# Altium project PowerCutMonitor-v1.0.PrjPcb
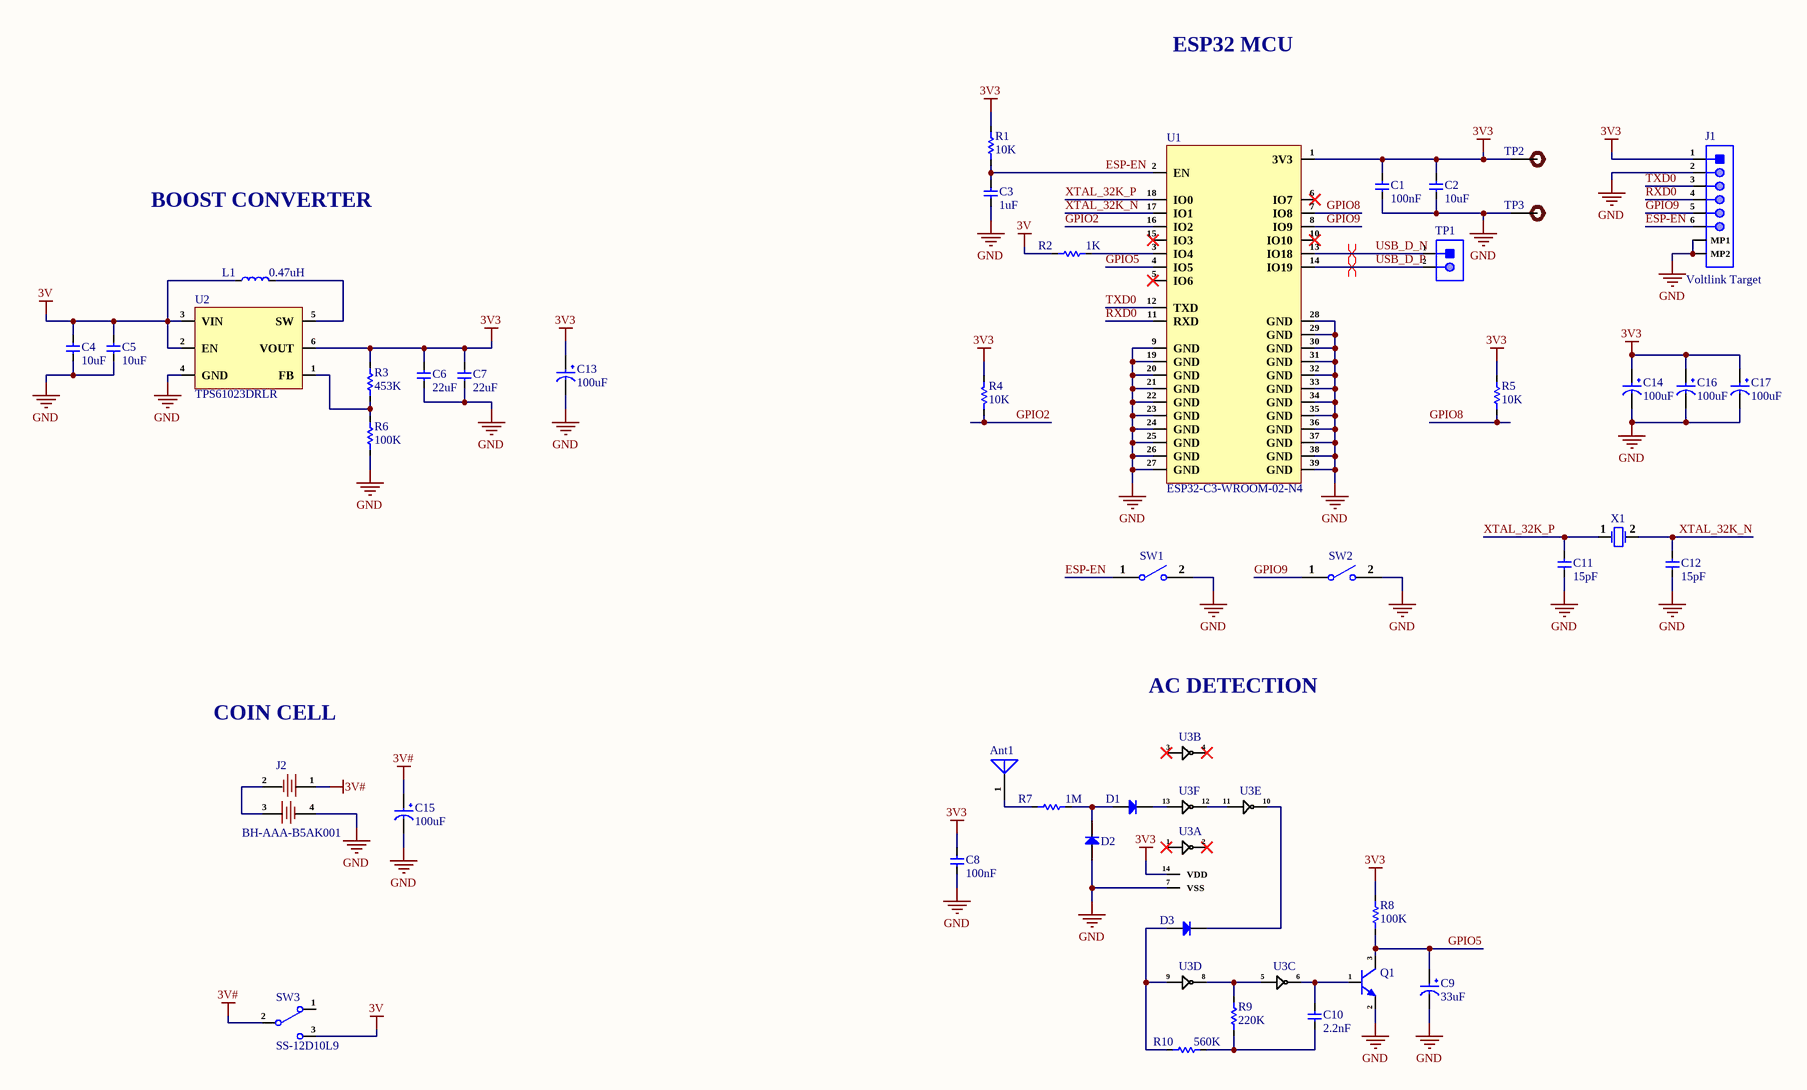
[diagram p0: Monitor-v1.0.SchDoc]
1 sheet, 45 parts. Net scope: global (net labels, ports and power ports of the same name join across sheets).
Board file: PowerCutMonitor-v1.0.PcbDoc

## Sheet Monitor-v1.0.SchDoc
size 420 x 297 mm; SheetNumber: 1; SheetTotal: 1

### Parts
Ant1  BW315SNX39-6W3  [BW315SNX39-6W3]  (value not drawn)
C1  100nF  [cap-0402]
C2  10uF  [Cap-0402]
C3  1uF  [Cap-0402]
C4  10uF  [Cap-0402]
C5  10uF  [Cap-0402]
C6  22uF  [Cap-0603]
C7  22uF  [Cap-0603]
C8  100nF  [cap-0402]
C9  33uF  [Case-B]
C10  2.2nF  [Cap-0402]
C11  15pF  [Cap-0402]
C12  15pF  [Cap-0402]
C13  100uF  [Case-B]
C14  100uF  [Case-B]
C15  100uF  [Case-B]
C16  100uF  [Case-B]
C17  100uF  [Case-B]
D1  1N4148W-7-F  [SOD-123]  (value not drawn)
D2  1N4148W-7-F  [SOD-123]  (value not drawn)
D3  1N4148W-7-F  [SOD-123]  (value not drawn)
J1  Voltlink Target  [Voltlink Target]
J2  BH-AAA-B5AK001  [BH-AAA-B5AK001]
L1  0.47uH  [SPM3015-R47N]
Q1  BC847C,215  [SOT-23]  (value not drawn)
R1  10K  [Res-0402]
R2  1K  [Res-0402]
R3  453K  [Res-0402]
R4  10K  [Res-0402]
R5  10K  [Res-0402]
R6  100K  [Res-0402]
R7  1M  [Res-0402]
R8  100K  [Res-0402]
R9  220K  [Res-0402]
R10  560K  [Res-0402]
SW1  B3U-1000P  [B3U-1000P]  (value not drawn)
SW2  B3U-1000P  [B3U-1000P]  (value not drawn)
SW3  SS-12D10L9  [SS-12D10L9]
TP1  2 Test Pad  [2 Test Pad]  (value not drawn)  (no BOM)
TP2  TEST POINT 0.5mm Dia  [Test-point - 0.5mm]  (value not drawn)  (no BOM)
TP3  TEST POINT 0.5mm Dia  [Test-point - 0.5mm]  (value not drawn)  (no BOM)
U1  ESP32-C3-WROOM-02-N4  [ESP32-C3-WROOM-02-N4]
U2  TPS61023DRLR  [SOT-563]
U3  CD4069  [SOP-14]  (value not drawn)  (parts A,B,C,D,E,F of 6)
X1  Q13FC13500004  [SMD3215-2P]  (value not drawn)

### Nets
3V: C4.2 C5.2 L1.1 R2.2 SW3.3 U2.2(EN) U2.3(VIN)
3V3: C1.2 C2.2 C6.2 C7.2 C8.2 C13.1 C14.1 C16.1 C17.1 J1.1 R1.2 R3.2 R4.2 R5.2 R8.2 TP2.1 U1.1(3V3) U2.6(VOUT) U3.14(VDD)
3V#: C15.1 J2.1 SW3.2
GND: C1.1 C2.1 C3.1 C4.1 C5.1 C6.1 C7.1 C8.1 C9.2 C11.1 C12.1 C13.2 C14.2 C15.2 C16.2 C17.2 D2.1(A) J1.2 J1.MP1 J1.MP2 J2.4 Q1.2(E) R6.1 SW1.2 SW2.2 TP3.1 U1.9(GND) U1.19(GND) U1.20(GND) U1.21(GND) U1.22(GND) U1.23(GND) U1.24(GND) U1.25(GND) U1.26(GND) U1.27(GND) U1.28(GND) U1.29(GND) U1.30(GND) U1.31(GND) U1.32(GND) U1.33(GND) U1.34(GND) U1.35(GND) U1.36(GND) U1.37(GND) U1.38(GND) U1.39(GND) U2.4(GND) U3.7(VSS)
ESP-EN: C3.2 J1.6 R1.1 SW1.1 U1.2(EN)
GPIO2: R4.1 U1.16(IO2)
GPIO5: C9.1 Q1.3(C) R8.1 U1.4(IO5)
GPIO8: R5.1 U1.7(IO8)
GPIO9: J1.5 SW2.1 U1.8(IO9)
RXD0: J1.4 U1.11(RXD)
TXD0: J1.3 U1.12(TXD)
USB_D_N: TP1.1 U1.13(IO18)
USB_D_P: TP1.2 U1.14(IO19)
XTAL_32K_N: C12.2 U1.17(IO1) X1.2(OSC2)
XTAL_32K_P: C11.2 U1.18(IO0) X1.1(OSC1)
NetAnt1_1: Ant1.1(FEED) R7.1
NetC10_1: C10.1 R9.1 R10.2
NetC10_2: C10.2 Q1.1(B) U3.6(Y3)
NetD1_1: D1.1(A) D2.2(K) R7.2
NetD1_2: D1.2(K) U3.13(A6)
NetD3_1: D3.1(A) R10.1 U3.9(A4)
NetD3_2: D3.2(K) U3.10(Y5)
NetJ2_2: J2.2 J2.3
NetL1_2: L1.2 U2.5(SW)
NetR2_1: R2.1 U1.3(IO4)
NetR3_1: R3.1 R6.2 U2.1(FB)
NetR9_2: R9.2 U3.5(A3) U3.8(Y4)
NetU3_11: U3.11(A5) U3.12(Y6)

Not connected (* = marked no-connect by the designer): SW3 1; U1 5(IO6)* 6(IO7)* 10(IO10)* 15(IO3)*; U3 1(A1)* 2(Y1)* 3(A2)* 4(Y2)*

### Layout directives
differential pair; net class USB_LINES: USB_D_N, USB_D_P

### Notes on the sheet
- ESP32 MCU
- BOOST CONVERTER
- COIN CELL
- AC DETECTION
- File:
- Title:
- Date:
- Page
- Num:
- Total:
- Drawn By: Huzaifa Ali

### Library data of the parts
Ant1 = BW315SNX39-6W3: 1.8 3dBi Vertical 50W Antennas ROHS; Manufacturer: BAT WIRELESS; Manufacturer Part Number: BW315SNX39-6W3; Package: Custom; LCSC Part Number: C496553; Item Type: Antenna; ComponentLink1Description: LCSC; ComponentLink1URL: https://www.lcsc.com/product-detail/Antennas_BAT-WIRELESS-BW315SNX39-6W3_C496553.html
C1 C8 = C1005X7R1H104KT000F: CAP CER 0.1UF 50V X7R 0402; Manufacturer: TDK; Tolerance: 10%; Voltage: 25V; Item Type: Capacitor; Supplier 1: Avnet; Manufacturer Part Number: C1005X7R1H104KT000F; RoHS: No; Category: Ceramic Capacitors; Dielectric: X7R; Supplier Part Number 1: C1005X7R1H104KT000F; LCSC Part Number: C361198; ComponentLink1Description: LCSC; ComponentLink1URL: https://www.lcsc.com/product-detail/Multilayer-Ceramic-Capacitors-MLCC-SMD-SMT_TDK-C1005X7R1H104KT000F_C361198.html
C2 C4 C5 = CC0402MRX5R6BB106: CAP CER 10UF 10V X5R 0402; Manufacturer: Yageo; Tolerance: 20%; Item Type: Capacitor; Supplier 1: Future Electronics; Manufacturer Part Number: CC0402MRX5R6BB106; RoHS: Yes; Category: Ceramic Capacitors; Stock 1: 80000; Pricing 1: 10000=0.02650, 20000=0.02590, 30000=0.02550, 40000=0.02530, 50000=0.02450 (USD); Mount: Surface Mount; Case/Package: 0402; Case Code (Imperial): 0402; Case Code (Metric): 1005; Min Operating Temperature: -55°C; Max Operating Temperature: 85°C; Packaging: Tape and Reel; Capacitance: 10uF; Voltage Rating: 10V; RoHS Compliant: Yes; ComponentLink1URL: http://www.yageo.com/documents/recent/UPY-GPHC_X5R_4V-to-50V_25.pdf?src-supplier=Digi-Key; ComponentLink1Description: http://www.yageo.com/documents/recent/UPY-GPHC_X5R_4V-to-50V_25.pdf?src-supplier=Digi-Key; Supplier Part Number 1: 6097631; LCSC Part Number: C962143
C3 = CC0402KRX5R7BB105: CAP CER 1UF 16V X5R 0402; Manufacturer: Yageo; Tolerance: 10%; Item Type: Capacitor; Supplier 1: Digi-Key; Manufacturer Part Number: CC0402KRX5R7BB105; Stock 1: 1405667; Pricing 1: 1=0.36, 10=0.252, 100=0.1512, 500=0.1134, 1000=0.09576, 2500=0.09072, 5000=0.08568 (USD); Mount: Surface Mount; Case/Package: 0402; Weight: 2.3E-05oz; Case Code (Imperial): 0402; Case Code (Metric): 1005; Min Operating Temperature: -55°C; Max Operating Temperature: 85°C; Capacitance: 1uF; Dielectric: X5R; Packaging: Tape and Reel; Voltage Rating (DC): 16V; Voltage Rating: 16V; Termination: SMD/SMT; Composition: Ceramic; Length: 1mm; Height: 0.5mm; Width: 0.02inch; Thickness: 0.022inch; Depth: 0.5mm; Radiation Hardening: No; Lead Free: Lead Free; Halogen Free: Halogen Free; ComponentLink1URL: http://www.yageo.com/documents/recent/UPY-GPHC_X5R_4V-to-50V_12.pdf?src-supplier=Avnet+Europe; ComponentLink1Description: http://www.yageo.com/documents/recent/UPY-GPHC_X5R_4V-to-50V_12.pdf?src-supplier=Avnet+Europe; Supplier Part Number 1: 311-1691-6-ND; LCSC Part Number: C325464
C6 C7 = CC0603MRX5R5BB226: CAP CER 22UF 6.3V X5R 0603; Manufacturer: Yageo; Tolerance: 20%; Supplier 1: Mouser; Manufacturer Part Number: CC0603MRX5R5BB226; RoHS: Yes; Category: Ceramic Capacitors; Stock 1: 3030; Pricing 1: 1=0.33000, 10=0.22500, 50=0.22500, 100=0.12800, 1000=0.07900, 10000=0.06500 (USD); Mount: Surface Mount; Case/Package: 0603; Case Code (Metric): 1608; Case Code (Imperial): 0603; Weight: 7.1E-05oz; Min Operating Temperature: -55°C; Max Operating Temperature: 85°C; Capacitance: 22uF; Packaging: Tape and Reel; Dielectric: X5R; Voltage Rating: 6.3V; Termination: SMD/SMT; Resistor Type: Ceramic; Voltage Rating (DC): 6.3V; Package Quantity: 4000; Length: 0.063inch; Width: 0.031inch; Thickness: 0.035inch; Depth: 0.8mm; Lead Free: Lead Free; Halogen Free: Halogen Free; RoHS Compliant: Yes; ComponentLink1URL: http://www.mouser.com/ds/2/447/Yageo_UPY-GP_NP0_16V-to-50V_9-358835.pdf?src-supplier=Mouser; ComponentLink1Description: http://www.mouser.com/ds/2/447/Yageo_UPY-GP_NP0_16V-to-50V_9-358835.pdf?src-supplier=Mouser; ComponentLink2URL: http://www.yageo.com/documents/recent/UPY-GPHC_X5R_4V-to-50V_25.pdf?src-supplier=Digi-Key; ComponentLink2Description: http://www.yageo.com/documents/recent/UPY-GPHC_X5R_4V-to-50V_25.pdf?src-supplier=Digi-Key; Supplier Part Number 1: 603-CC603MRX5R5BB226; LCSC Part Number: C109448
C9 = TAJB336K010RNJ: CAP TANT 33UF 10% 10V 1411; Manufacturer: Kyocera AVX; Dielectric Material: Tantalum; ESR (Equivalent Series Resistance): 1.8R; Leakage Current: 3.3uA; Polarity: Polar; Dissipation Factor: 6%; Item Type: Capacitor; Supplier 1: Rs; Manufacturer Part Number: TAJB336K010RNJ; RoHS: Yes; Category: Tantalum Capacitors; Stock 1: 1580; Pricing 1: 100=0.01410, 400=0.24800, 1000=0.21600 (GBP); Mounting Technology: Surface Mount,PCB; Case/Package: 1210; Pins: 2; Case Code (Metric): 3528; Case Code (Imperial): 1210; Min Operating Temperature: -55°C; Max Operating Temperature: 125°C; Tolerance: 10%; Value: 33uF; Packaging: Tape and Reel; Voltage Rating: 10V; Voltage Rating (DC): 10V; Package Quantity: 1; Termination: SMD/SMT; Voltage: 10V; Features: General Purpose; Series: TAJ; Construction: Flat; Length: 3.5mm; Width: 2.8mm; Height: 1.9mm; Height - Seated (Max): 0.083inch; Depth: 2.8mm; Lead Pitch: 1.4mm; Radiation Hardening: No; Reach SVHC Compliant: Yes; Lead Free: Lead Free; RoHS Compliant: Yes; ComponentLink1URL: https://datasheet.ciiva.com/26341/559435-da-01-en-tacc-b-3-2-mm-x-2-5-mm-x-1-9-mm-33-uf-26341776.pdf?src-supplier=Conrad; ComponentLink1Description: https://datasheet.ciiva.com/26341/559435-da-01-en-tacc-b-3-2-mm-x-2-5-mm-x-1-9-mm-33-uf-26341776.pdf?src-supplier=Conrad; ComponentLink2URL: https://datasheet.ciiva.com/7775/49917-7775706.pdf?src-supplier=Element14; ComponentLink2Description: https://datasheet.ciiva.com/7775/49917-7775706.pdf?src-supplier=Element14; ComponentLink3URL: https://datasheet.ciiva.com/7775/49917-7775705.pdf?src-supplier=Element14; ComponentLink3Description: https://datasheet.ciiva.com/7775/49917-7775705.pdf?src-supplier=Element14; ComponentLink4URL: https://datasheet.ciiva.com/7775/1680476-7775704.pdf?src-supplier=Element14; ComponentLink4Description: https://datasheet.ciiva.com/7775/1680476-7775704.pdf?src-supplier=Element14; ComponentLink5URL: https://datasheet.ciiva.com/264/taj-264134.pdf?src-supplier=Digi-Key; ComponentLink5Description: https://datasheet.ciiva.com/264/taj-264134.pdf?src-supplier=Digi-Key; ComponentLink6URL: https://datasheet.ciiva.com/264/taj-264133.pdf?src-supplier=Digi-Key; ComponentLink6Description: https://datasheet.ciiva.com/264/taj-264133.pdf?src-supplier=Digi-Key; ComponentLink7URL: https://datasheet.ciiva.com/264/taj-264135.pdf?src-supplier=Digi-Key; ComponentLink7Description: https://datasheet.ciiva.com/264/taj-264135.pdf?src-supplier=Digi-Key; ComponentLink8URL: https://datasheet.ciiva.com/12884/taj-27497-12884279.pdf?src-supplier=Mouser; ComponentLink8Description: https://datasheet.ciiva.com/12884/taj-27497-12884279.pdf?src-supplier=Mouser; ComponentLink9URL: https://datasheet.ciiva.com/14590/70001050-14590215.pdf?src-supplier=Allied+Electronics; ComponentLink9Description: https://datasheet.ciiva.com/14590/70001050-14590215.pdf?src-supplier=Allied+Electronics; ComponentLink10URL: https://datasheet.ciiva.com/14592/70001050-14592670.pdf?src-supplier=Allied+Electronics; ComponentLink10Description: https://datasheet.ciiva.com/14592/70001050-14592670.pdf?src-supplier=Allied+Electronics; ComponentLink11URL: https://datasheet.ciiva.com/11224/taj-11224937.pdf?src-supplier=Avnet; ComponentLink11Description: https://datasheet.ciiva.com/11224/taj-11224937.pdf?src-supplier=Avnet; ComponentLink12URL: https://datasheet.ciiva.com/16492/taj-16492863.pdf?src-supplier=Future+Electronics; ComponentLink12Description: https://datasheet.ciiva.com/16492/taj-16492863.pdf?src-supplier=Future+Electronics; ComponentLink13URL: https://datasheet.ciiva.com/11224/taj-11224941.pdf?src-supplier=Avnet; ComponentLink13Description: https://datasheet.ciiva.com/11224/taj-11224941.pdf?src-supplier=Avnet; Supplier Part Number 1: 1364604P; LCSC Part Number: C7202
C10 = 04025C222JAT2A: CAP CER 2.2nF 50V X7R ±5% 0402 MLCC - SMD/SMT ROHS; Manufacturer: Kyocera AVX; Item Type: Capacitor; Manufacturer Part Number: 04025C222JAT2A; Package: 0402; LCSC Part Number: C597041; ComponentLink1Description: LCSC; ComponentLink1URL: https://www.lcsc.com/product-detail/Multilayer-Ceramic-Capacitors-MLCC-SMD-SMT_Kyocera-AVX-04025C222JAT2A_C597041.html
C11 C12 = CQ0402GRNPO9BN150: CAP CER 15PF 50V C0G/NPO 0402; Manufacturer: Yageo; Item Type: Capacitors; Tolerance: 2%; Dielectric: C0G; Supplier: Digikey; LCSC Part Number: C577406; Manufacturer Part Number: CQ0402GRNPO9BN150; RoHS: Yes; Pricing: 10000=0.04366 (USD); Mounting Technology: Surface Mount; Case/Package: 0402; Case Code (Imperial): 0402; Case Code (Metric): 1005; Weight: 2.3E-05oz; Min Operating Temperature: -55°C; Max Operating Temperature: 125°C; Value: 15pF; Packaging: Tape and Reel; Voltage Rating: 50V; Voltage Rating (DC): 50V; Package Quantity: 10000; Series: CQ; ComponentLink1URL: http://www.mouser.com/ds/2/447/UPY-High%20Q_NP0_16V-to-250V_11-533944.pdf?src-supplier=Mouser; ComponentLink1Description: http://www.mouser.com/ds/2/447/UPY-High%20Q_NP0_16V-to-250V_11-533944.pdf?src-supplier=Mouser; ComponentLink2URL: http://www.yageo.com/documents/recent/UPY-High%20Q_NP0_16V-to-250V_13.pdf?src-supplier=Digikey; ComponentLink2Description: http://www.yageo.com/documents/recent/UPY-High%20Q_NP0_16V-to-250V_13.pdf?src-supplier=Digikey
C13-C17 = TPSB107M006R0250: CAP TANT 100UF 20% 6.3V 1411; Manufacturer: Kyocera AVX; Item Type: Tantalum Capacitors; Supplier: Digikey; LCSC Part Number: C283239; Manufacturer Part Number: TPSB107M006R0250; RoHS: Yes; Stock: 19045; Pricing: 1=0.8, 10=0.504, 50=0.3874, 100=0.3515, 500=0.29072, 1000=0.27195 (USD); ComponentLink1URL: https://datasheet.ciiva.com/16501/tps-16501597.pdf?src-supplier=Future+Electronics; ComponentLink1Description: https://datasheet.ciiva.com/16501/tps-16501597.pdf?src-supplier=Future+Electronics; ComponentLink2URL: https://datasheet.ciiva.com/3004/tps-3004598.pdf?src-supplier=Avnet; ComponentLink2Description: https://datasheet.ciiva.com/3004/tps-3004598.pdf?src-supplier=Avnet; ComponentLink3URL: https://datasheet.ciiva.com/264/tps-264115.pdf?src-supplier=Digikey; ComponentLink3Description: https://datasheet.ciiva.com/264/tps-264115.pdf?src-supplier=Digikey; ComponentLink4URL: https://datasheet.ciiva.com/264/tps-264116.pdf?src-supplier=Digikey; ComponentLink4Description: https://datasheet.ciiva.com/264/tps-264116.pdf?src-supplier=Digikey; ComponentLink5URL: https://datasheet.ciiva.com/264/tps-264117.pdf?src-supplier=Digikey; ComponentLink5Description: https://datasheet.ciiva.com/264/tps-264117.pdf?src-supplier=Digikey
D1-D3 = 1N4148W-7-F: DIODE GEN PURP 100V 300MA SOD123; Manufacturer: Diodes; Forward Current: 150mA; Reverse Recovery Time: 4ns; Max Forward Surge Current (Ifsm): 2A; Element Configuration: Single; Max Reverse Current: 1uA; Forward Voltage: 1.25V; Power Dissipation: 400mW; Polarity: Standard; Voltage Rating (DC): 75V; Value: 2pF; Supplier 1: Future Electronics; Manufacturer Part Number: 1N4148W-7-F; RoHS: Yes; Category: Rectifier Diodes; Stock 1: 32931000; Pricing 1: 3000=0.01840, 12000=0.01760, 45000=0.01690, 120000=0.01640, 300000=0.01560 (USD); Mounting Technology: Surface Mount; Pins: 2; Weight: 0.000353oz; Contact Plating: Tin,Matte; Min Operating Temperature: -65°C; Max Operating Temperature: 150°C; Packaging: Tape and Reel; Max Repetitive Reverse Voltage (Vrrm): 100V; Peak Non-Repetitive Surge Current: 2A; Voltage: 100V; Max Surge Current: 2A; Package Quantity: 3000; Recovery Time: 4ns; Average Rectified Current: 300mA; Power Rating: 400mW; Current Rating: 150mA; Output Current: 150mA; Max Reverse Voltage (DC): 100V; Series: -; Reverse Recovery Time-Max: 4ns; Length: 2.85mm; Width: 1.7mm; Height: 1.25mm; Radiation Hardening: No; RoHS Compliant: Yes; Reach SVHC Compliant: Yes; Lead Free: Lead Free; ComponentLink1URL: https://datasheet.ciiva.com/1179/1915529-1179304.pdf?src-supplier=Element14; ComponentLink1Description: https://datasheet.ciiva.com/1179/1915529-1179304.pdf?src-supplier=Element14; ComponentLink2URL: https://datasheet.ciiva.com/22695/1915529-22695239.pdf?src-supplier=Element14; ComponentLink2Description: https://datasheet.ciiva.com/22695/1915529-22695239.pdf?src-supplier=Element14; ComponentLink3URL: https://datasheet.ciiva.com/8300/ds30086-8300392.pdf?src-supplier=Avnet; ComponentLink3Description: https://datasheet.ciiva.com/8300/ds30086-8300392.pdf?src-supplier=Avnet; ComponentLink4URL: https://datasheet.ciiva.com/15219/getdatasheetpartid-110030-15219548.pdf?src-supplier=Verical; ComponentLink4Description: https://datasheet.ciiva.com/15219/getdatasheetpartid-110030-15219548.pdf?src-supplier=Verical; ComponentLink5URL: https://datasheet.ciiva.com/8303/ds30086-8303197.pdf?src-supplier=Avnet; ComponentLink5Description: https://datasheet.ciiva.com/8303/ds30086-8303197.pdf?src-supplier=Avnet; ComponentLink6URL: https://datasheet.ciiva.com/911/ds30086-911735.pdf?src-supplier=Digi-Key; ComponentLink6Description: https://datasheet.ciiva.com/911/ds30086-911735.pdf?src-supplier=Digi-Key; ComponentLink7URL: https://datasheet.ciiva.com/911/ds30086-911736.pdf?src-supplier=Digi-Key; ComponentLink7Description: https://datasheet.ciiva.com/911/ds30086-911736.pdf?src-supplier=Digi-Key; ComponentLink8URL: https://datasheet.ciiva.com/911/ds30086-911734.pdf?src-supplier=Digi-Key; ComponentLink8Description: https://datasheet.ciiva.com/911/ds30086-911734.pdf?src-supplier=Digi-Key; ComponentLink9URL: https://datasheet.ciiva.com/4435/ds30086-4435128.pdf?src-supplier=Mouser; ComponentLink9Description: https://datasheet.ciiva.com/4435/ds30086-4435128.pdf?src-supplier=Mouser; Supplier Part Number 1: 7634694; LCSC Part Number: C83528; Item Type: Diode
J1 = C145963: 1x6P SH 1 1mm 6 SMD,P=1mm Wire To Board / Wire To Wire Connector ROHS; Manufacturer: BOOMELE; Manufacturer Part Number: C145963; Package: SMD,P=1mm; LCSC Part Number: C145963; Item Type: Connector; ComponentLink1Description: LCSC; ComponentLink1URL: https://www.lcsc.com/product-detail/Wire-To-Board-Wire-To-Wire-Connector_BOOMELE-Boom-Precision-Elec-C145963_C145963.html
J2 = BH-AAA-B5AK001: Battery box Tin -25℃~+85℃ Phosphor Bronze No. 7 SMD Button And Strip Battery Connector ROHS; Manufacturer: MYOUNG; Item Type: Battery Holder; Manufacturer Part Number: BH-AAA-B5AK001; Package: SMD; LCSC Part Number: C964882; ComponentLink1Description: LCSC; ComponentLink1URL: https://www.lcsc.com/product-detail/Button-And-Strip-Battery-Connector_MYOUNG-BH-AAA-B5AK001_C964882.html
L1 = SPM3015-R47N: 3.7A 0.47uH ±30% 6A 1212 Power Inductors ROHS; Manufacturer: KOHERelec; Manufacturer Part Number: SPM3015-R47N; Package: 1212; LCSC Part Number: C2761886; Item Type: Inductor; ComponentLink1Description: LCSC; ComponentLink1URL: https://www.lcsc.com/product-detail/Power-Inductors_KOHERelec-SPM3015-R47N_C2761886.html?s_z=n_744383350047
Q1 = BC847C,215: TRANS NPN 45V 0.1A TO-236AB; Manufacturer: Nexperia; Item Type: BJTs; Polarity: 5054Direction; Supplier: Future Electronics; LCSC Part Number: C8664; Manufacturer Part Number: BC847C,215; RoHS: Yes; Stock: 18000; Pricing: 3000=0.0084, 12000=0.0081, 30000=0.0079, 75000=0.0077, 120000=0.0074 (USD); Pins: 3NUMBER; Packaging: 13Packaging; RoHS Compliant: Yes; ComponentLink1URL: http://www.farnell.com/datasheets/1856333.pdf?src-supplier=Farnell; ComponentLink1Description: http://www.farnell.com/datasheets/1856333.pdf?src-supplier=Farnell; ComponentLink2URL: https://assets.nexperia.com/documents/data-sheet/BC847_SER.pdf?src-supplier=Digikey; ComponentLink2Description: https://assets.nexperia.com/documents/data-sheet/BC847_SER.pdf?src-supplier=Digikey; ComponentLink3URL: https://datasheet.octopart.com/BC847C%2C215-NXP-Semiconductors-datasheet-20734447.pdf?src-supplier=Farnell; ComponentLink3Description: https://datasheet.octopart.com/BC847C%2C215-NXP-Semiconductors-datasheet-20734447.pdf?src-supplier=Farnell; ComponentLink4URL: https://datasheet.octopart.com/BC847C%2C215-Nexperia-datasheet-164345412.pdf?src-supplier=Future+Electronics; ComponentLink4Description: https://datasheet.octopart.com/BC847C%2C215-Nexperia-datasheet-164345412.pdf?src-supplier=Future+Electronics; ComponentLink5URL: https://datasheet.octopart.com/BC847C%2C215-Nexperia-datasheet-11982477.pdf?src-supplier=Newark; ComponentLink5Description: https://datasheet.octopart.com/BC847C%2C215-Nexperia-datasheet-11982477.pdf?src-supplier=Newark; ComponentLink6URL: https://datasheet.octopart.com/BC847C%2C215-Nexperia-datasheet-5341283.pdf?src-supplier=TME; ComponentLink6Description: https://datasheet.octopart.com/BC847C%2C215-Nexperia-datasheet-5341283.pdf?src-supplier=TME
R1 R4 R5 = RC0402FR-0710KL: RES 10K OHM 1% 1/16W 0402; Manufacturer: Yageo; Resistance: 10kR; Voltage Rating (DC): 50V; Temperature Coefficient: 100ppm/°C; Power Rating: 62.5mW; Max Power Dissipation: 63mW; Item Type: Resistor; Supplier 1: Mouser; Manufacturer Part Number: RC0402FR-0710KL; RoHS: Yes; Category: Chip SMD Resistors; Stock 1: 18648329; Pricing 1: 1=0.10000, 10=0.01400, 50=0.01400, 100=0.00500, 1000=0.00300, 10000=0.00200 (USD); Case/Package: 0402; Number of Pins: 2; Case Code (Imperial): 0402; Case Code (Metric): 1005; Min Operating Temperature: -55°C; Max Operating Temperature: 155°C; Resistor Type: Thick Film; Tolerance: 1%; Packaging: Tape and Reel; Voltage Rating: 50V; Termination: SMD/SMT; Working Voltage: 50V; Number of Terminations: 2; Features: Moisture Resistant; Series: RC; Resistance Tolerance: 1%; Construction: Rectangular; Length: 1mm; Width: 0.5mm; Height: 0.32mm; Depth: 0.5mm; Lead Pitch: 0.2mm; REACH SVHC: No SVHC; Lead Free: Lead Free; RoHS Compliant: Yes; Military Standard: Not; ComponentLink1URL: https://datasheet.ciiva.com/7660/38568-7660787.pdf?src-supplier=Element14; ComponentLink1Description: https://datasheet.ciiva.com/7660/38568-7660787.pdf?src-supplier=Element14; ComponentLink2URL: https://datasheet.ciiva.com/7849/1686128-7849814.pdf?src-supplier=Element14; ComponentLink2Description: https://datasheet.ciiva.com/7849/1686128-7849814.pdf?src-supplier=Element14; ComponentLink3URL: https://datasheet.ciiva.com/7983/1018594-7983486.pdf?src-supplier=Element14; ComponentLink3Description: https://datasheet.ciiva.com/7983/1018594-7983486.pdf?src-supplier=Element14; ComponentLink4URL: https://datasheet.ciiva.com/22747/1018594-22747512.pdf?src-supplier=Element14; ComponentLink4Description: https://datasheet.ciiva.com/22747/1018594-22747512.pdf?src-supplier=Element14; ComponentLink5URL: https://datasheet.ciiva.com/12667/pyu-rc0402-51-rohs-l-6-r-12667067.pdf?src-supplier=Mouser; ComponentLink5Description: https://datasheet.ciiva.com/12667/pyu-rc0402-51-rohs-l-6-r-12667067.pdf?src-supplier=Mouser; ComponentLink6URL: https://datasheet.ciiva.com/7849/1784430-7849813.pdf?src-supplier=Element14; ComponentLink6Description: https://datasheet.ciiva.com/7849/1784430-7849813.pdf?src-supplier=Element14; ComponentLink7URL: https://datasheet.ciiva.com/7849/1784430-7849815.pdf?src-supplier=Element14; ComponentLink7Description: https://datasheet.ciiva.com/7849/1784430-7849815.pdf?src-supplier=Element14; Supplier Part Number 1: 603-RC0402FR-0710KL; LCSC Part Number: C60490
R2 = RC0402FR-071KL: RES 1K OHM 1% 1/16W 0402; Manufacturer: Yageo; Resistance: 1kR; Temperature Coefficient: 100ppm/°C; Voltage Rating (DC): 50V; Power Rating: 62.5mW; Max Power Dissipation: 63mW; Item Type: Resistor; Supplier 1: Avnet; Manufacturer Part Number: RC0402FR-071KL; RoHS: Yes; Category: Chip SMD Resistors; Stock 1: 13030000; Pricing 1: 10000=0.00085, 20000=0.00087, 40000=0.00084, 60000=0.00083, 80000=0.00079, 100000=0.00078, 1000000=0.00076 (USD); Case/Package: 0402; Number of Pins: 2; Case Code (Imperial): 0402; Case Code (Metric): 1005; Size Code: 0402; Min Operating Temperature: -55°C; Max Operating Temperature: 155°C; Resistor Type: Thick Film; Tolerance: 1%; Packaging: Tape and Reel; Voltage Rating: 50V; Termination: SMD/SMT; Features: Moisture Resistant; Series: RC; Number of Terminations: 2; Resistance Tolerance: 1%; Construction: Rectangular; Technology: THICK FILM; Length: 1mm; Width: 0.5mm; Height: 0.32mm; Depth: 0.5mm; Reach SVHC Compliant: Yes; Lead Free: Lead Free; RoHS Compliant: Yes; Military Standard: Not; ComponentLink1URL: https://datasheet.ciiva.com/11819/0900766b80c66297-11819477.pdf?src-supplier=RSComponents; ComponentLink1Description: https://datasheet.ciiva.com/11819/0900766b80c66297-11819477.pdf?src-supplier=RSComponents; ComponentLink2URL: https://datasheet.ciiva.com/7983/1018594-7983502.pdf?src-supplier=Element14; ComponentLink2Description: https://datasheet.ciiva.com/7983/1018594-7983502.pdf?src-supplier=Element14; ComponentLink3URL: https://datasheet.ciiva.com/22747/1018594-22747513.pdf?src-supplier=Element14; ComponentLink3Description: https://datasheet.ciiva.com/22747/1018594-22747513.pdf?src-supplier=Element14; ComponentLink4URL: https://datasheet.ciiva.com/12666/pyu-rc0402-51-rohs-l-6-r-12666741.pdf?src-supplier=Mouser; ComponentLink4Description: https://datasheet.ciiva.com/12666/pyu-rc0402-51-rohs-l-6-r-12666741.pdf?src-supplier=Mouser; ComponentLink5URL: https://datasheet.ciiva.com/7849/1018594-7849869.pdf?src-supplier=Element14; ComponentLink5Description: https://datasheet.ciiva.com/7849/1018594-7849869.pdf?src-supplier=Element14; ComponentLink6URL: https://datasheet.ciiva.com/7849/1018594-7849871.pdf?src-supplier=Element14; ComponentLink6Description: https://datasheet.ciiva.com/7849/1018594-7849871.pdf?src-supplier=Element14; ComponentLink7URL: https://datasheet.ciiva.com/17063/pyu-rc0402-51-rohs-l-6-r-17063193.pdf?src-supplier=Future+Electronics; ComponentLink7Description: https://datasheet.ciiva.com/17063/pyu-rc0402-51-rohs-l-6-r-17063193.pdf?src-supplier=Future+Electronics; Supplier Part Number 1: RC0402FR-071KL; LCSC Part Number: C106235
R3 = RC0402FR-07453KL: RES 453K OHM 1% 1/16W 0402; Manufacturer: Yageo; Item Type: Resistors; Voltage Rating (DC): 50V; Supplier: Digikey; LCSC Part Number: C137978; Manufacturer Part Number: RC0402FR-07453KL; RoHS: Yes; Stock: 42641; Pricing: 1=0.1, 10=0.007, 100=0.0051, 1000=0.00408, 2500=0.00306 (USD); Lead Free: 5697LeadFree; ComponentLink1URL: https://datasheet.ciiva.com/8885/pyu-rc0402-51-rohs-l-6-8885671.pdf?src-supplier=Avnet; ComponentLink1Description: https://datasheet.ciiva.com/8885/pyu-rc0402-51-rohs-l-6-8885671.pdf?src-supplier=Avnet; ComponentLink2URL: https://datasheet.ciiva.com/26830/getdatasheetpartid-325135-26830117.pdf?src-supplier=Verical; ComponentLink2Description: https://datasheet.ciiva.com/26830/getdatasheetpartid-325135-26830117.pdf?src-supplier=Verical; ComponentLink3URL: https://datasheet.ciiva.com/17086/pyu-rc0402-51-rohs-l-6-r-17086533.pdf?src-supplier=Future+Electronics; ComponentLink3Description: https://datasheet.ciiva.com/17086/pyu-rc0402-51-rohs-l-6-r-17086533.pdf?src-supplier=Future+Electronics
R6 R8 = RC0402FR-07100KL: RES 100K OHM 1% 1/16W 0402; Manufacturer: Yageo; Resistance: 100kR; Temperature Coefficient: 100ppm/°C; Power Rating: 63mW; Voltage Rating: 50V; Item Type: Resistor; Supplier 1: Mouser; Manufacturer Part Number: RC0402FR-07100KL; RoHS: Yes; Category: Chip SMD Resistors; Stock 1: 7759549; Pricing 1: 1=0.10000, 10=0.01200, 50=0.01200, 100=0.00500, 1000=0.00300, 2500=0.00200, 10000=0.00100 (USD); Case/Package: 0402; Case Code (Metric): 1005; Case Code (Imperial): 0402; Min Operating Temperature: -55°C; Max Operating Temperature: 155°C; Resistor Type: Thick Film; Tolerance: 1%; Packaging: Tape and Reel; Package Quantity: 1; Number of Terminations: 2; Termination: SMD/SMT; Max Power Dissipation: 63mW; Working Voltage: 50V; Features: Moisture Resistant; Series: RC; Resistance Tolerance: 1%; Construction: Rectangular; Technology: THICK FILM; Length: 0.039inch; Width: 0.02inch; Height: 0.016inch; Depth: 0.5mm; REACH SVHC: No SVHC; Lead Free: Lead Free; RoHS Compliant: Yes; Military Standard: Not; ComponentLink1URL: https://datasheet.ciiva.com/11819/0900766b80c66297-11819452.pdf?src-supplier=RSComponents; ComponentLink1Description: https://datasheet.ciiva.com/11819/0900766b80c66297-11819452.pdf?src-supplier=RSComponents; ComponentLink2URL: https://datasheet.ciiva.com/22747/1018594-22747509.pdf?src-supplier=Element14; ComponentLink2Description: https://datasheet.ciiva.com/22747/1018594-22747509.pdf?src-supplier=Element14; ComponentLink3URL: https://datasheet.ciiva.com/2453/pyu-r-int-thick-7-2453362.pdf?src-supplier=Digi-Key; ComponentLink3Description: https://datasheet.ciiva.com/2453/pyu-r-int-thick-7-2453362.pdf?src-supplier=Digi-Key; ComponentLink4URL: https://datasheet.ciiva.com/2453/pyu-r-int-thick-7-2453363.pdf?src-supplier=Digi-Key; ComponentLink4Description: https://datasheet.ciiva.com/2453/pyu-r-int-thick-7-2453363.pdf?src-supplier=Digi-Key; ComponentLink5URL: https://datasheet.ciiva.com/2453/pyu-r-int-thick-7-2453361.pdf?src-supplier=Digi-Key; ComponentLink5Description: https://datasheet.ciiva.com/2453/pyu-r-int-thick-7-2453361.pdf?src-supplier=Digi-Key; ComponentLink6URL: https://datasheet.ciiva.com/12667/pyu-rc0402-51-rohs-l-6-r-12667930.pdf?src-supplier=Mouser; ComponentLink6Description: https://datasheet.ciiva.com/12667/pyu-rc0402-51-rohs-l-6-r-12667930.pdf?src-supplier=Mouser; ComponentLink7URL: https://datasheet.ciiva.com/15189/getdatasheetpartid-323696-15189334.pdf?src-supplier=Verical; ComponentLink7Description: https://datasheet.ciiva.com/15189/getdatasheetpartid-323696-15189334.pdf?src-supplier=Verical; Supplier Part Number 1: 603-RC0402FR-07100KL; LCSC Part Number: C60491
R7 = RC0402FR-071ML: RES 1M OHM 1% 1/16W 0402; Manufacturer: Yageo; Value: 1MR; Power Rating: 63mW; Voltage Rating: 50V; Temperature Coefficient: 100ppm/°C; Item Type: Resistor; Supplier: Digikey; Supplier Part Number: 311-1.00MLRCT-ND; Manufacturer Part Number: RC0402FR-071ML; RoHS: Yes; Category: Chip SMD Resistors; Stock: 6516; Pricing: 1=0.1, 10=0.015, 50=0.0088, 100=0.0073, 500=0.00488, 1000=0.00417, 5000=0.00297 (USD); Case/Package: 0402; Case Code (Imperial): 0402; Case Code (Metric): 1005; Min Operating Temperature: -55°C; Max Operating Temperature: 155°C; Resistor Type: Thick Film; Packaging: Tape and Reel; Tolerance: 1%; Termination: SMD/SMT; Features: Moisture Resistant; Series: RC; Max Power Dissipation: 63mW; Number of Terminations: 2; Resistance Tolerance: 1%; Construction: Rectangular; Technology: THICK FILM; Voltage Rating (AC): 50V; Length: 1mm; Height: 0.32mm; Depth: 0.5mm; RoHS Compliant: Yes; Military Standard: Not; Reach SVHC Compliant: Unknown; Lead Free: 5697LeadFree; ComponentLink1URL: https://datasheet.ciiva.com/11808/0900766b80c66297-11808125.pdf?src-supplier=Rs; ComponentLink1Description: https://datasheet.ciiva.com/11808/0900766b80c66297-11808125.pdf?src-supplier=Rs; ComponentLink2URL: https://datasheet.ciiva.com/46394/1018594-46394951.pdf?src-supplier=Element14; ComponentLink2Description: https://datasheet.ciiva.com/46394/1018594-46394951.pdf?src-supplier=Element14; ComponentLink3URL: https://datasheet.ciiva.com/7849/1018594-7849883.pdf?src-supplier=Element14; ComponentLink3Description: https://datasheet.ciiva.com/7849/1018594-7849883.pdf?src-supplier=Element14; ComponentLink4URL: https://datasheet.ciiva.com/7849/1018594-7849882.pdf?src-supplier=Element14; ComponentLink4Description: https://datasheet.ciiva.com/7849/1018594-7849882.pdf?src-supplier=Element14; ComponentLink5URL: https://datasheet.ciiva.com/16741/pyu-rc0402-51-rohs-l-6-r-16741081.pdf?src-supplier=Future+Electronics; ComponentLink5Description: https://datasheet.ciiva.com/16741/pyu-rc0402-51-rohs-l-6-r-16741081.pdf?src-supplier=Future+Electronics; LCSC Part Number: C138033
R9 = RC0402FR-07220KL: RES 220K OHM 1% 1/16W 0402; Manufacturer: Yageo; Resistance: 220kR; Power Rating: 62.5mW; Voltage Rating: 50V; Temperature Coefficient: 100ppm/°C; Max Power Dissipation: 63mW; Item Type: Resistor; Supplier 1: Arrow Electronics; Manufacturer Part Number: RC0402FR-07220KL; RoHS: Yes; Category: Chip SMD Resistors; Stock 1: 210000; Pricing 1: 10000=0.00130 (USD); Case/Package: 0402; Case Code (Imperial): 0402; Case Code (Metric): 1005; Weight: 2.3E-05oz; Size Code: 0402; Min Operating Temperature: -55°C; Max Operating Temperature: 155°C; Tolerance: 1%; Package Quantity: 1; Packaging: Tape and Reel; Termination: SMD/SMT; Resistor Type: Thick Film; Number of Terminations: 2; Features: Moisture Resistant; Series: RC; Resistance Tolerance: 1%; Technology: THICK FILM; Construction: Rectangular; Length: 1mm; Width: 0.02inch; Height: 0.016inch; Depth: 0.5mm; RoHS Compliant: Yes; Reach SVHC Compliant: Yes; Military Standard: Not; Lead Free: Lead Free; ComponentLink1URL: https://datasheet.ciiva.com/11808/0900766b80c66297-11808792.pdf?src-supplier=RSComponents; ComponentLink1Description: https://datasheet.ciiva.com/11808/0900766b80c66297-11808792.pdf?src-supplier=RSComponents; ComponentLink2URL: https://datasheet.ciiva.com/5924/1018594-5924944.pdf?src-supplier=Farnell; ComponentLink2Description: https://datasheet.ciiva.com/5924/1018594-5924944.pdf?src-supplier=Farnell; ComponentLink3URL: https://datasheet.ciiva.com/2453/pyu-r-int-thick-7-2453533.pdf?src-supplier=Digi-Key; ComponentLink3Description: https://datasheet.ciiva.com/2453/pyu-r-int-thick-7-2453533.pdf?src-supplier=Digi-Key; ComponentLink4URL: https://datasheet.ciiva.com/2453/pyu-r-int-thick-7-2453534.pdf?src-supplier=Digi-Key; ComponentLink4Description: https://datasheet.ciiva.com/2453/pyu-r-int-thick-7-2453534.pdf?src-supplier=Digi-Key; ComponentLink5URL: https://datasheet.ciiva.com/2453/pyu-r-int-thick-7-2453532.pdf?src-supplier=Digi-Key; ComponentLink5Description: https://datasheet.ciiva.com/2453/pyu-r-int-thick-7-2453532.pdf?src-supplier=Digi-Key; ComponentLink6URL: https://datasheet.ciiva.com/12577/pyu-rc0402-51-rohs-l-6-r-12577270.pdf?src-supplier=Mouser; ComponentLink6Description: https://datasheet.ciiva.com/12577/pyu-rc0402-51-rohs-l-6-r-12577270.pdf?src-supplier=Mouser; Supplier Part Number 1: RC0402FR-07220KL; LCSC Part Number: C138030
R10 = 0402WGF5603TCE: 62.5mW Thick Film Resistors 50V ±100ppm/℃ ±1% 560kΩ 0402 Chip Resistor - Surface Mount ROHS; Manufacturer: UNI-ROYAL(Uniroyal Elec); Manufacturer Part Number: 0402WGF5603TCE; Package: 0402; LCSC Part Number: C132339; Item Type: Resistor; ComponentLink1Description: LCSC; ComponentLink1URL: https://www.lcsc.com/product-detail/Chip-Resistor-Surface-Mount_UNI-ROYAL-Uniroyal-Elec-0402WGF5603TCE_C132339.html
SW1 SW2 = B3U-1000P: SWITCH TACTILE SPST-NO 0.05A 12V; Manufacturer: Omron; Mechanical Life: 200000Cycles; Operating Force: 1.5N; Throw Configuration: SPST; Current Rating: 50mA; Contact Resistance: 100mR; Illumination Type: Non-Illuminated,Illuminated; Switch Travel: 0.15mm; Switch Function: Off-Mom; Actuator Type: Standard; Actuator Length: 0.4mm; Ratings: Dust Proof,IP40; ComponentLink1URL: http://www.farnell.com/datasheets/60838.pdf?src-supplier=Farnell; ComponentLink1Description: http://www.farnell.com/datasheets/60838.pdf?src-supplier=Farnell; ComponentLink2URL: http://www.farnell.com/datasheets/60838.pdf?src-supplier=Element14; ComponentLink2Description: http://www.farnell.com/datasheets/60838.pdf?src-supplier=Element14; ComponentLink3URL: https://omronfs.omron.com/en_US/ecb/products/pdf/en-b3u.pdf?src-supplier=Digi-Key; ComponentLink3Description: https://omronfs.omron.com/en_US/ecb/products/pdf/en-b3u.pdf?src-supplier=Digi-Key; ComponentLink4URL: http://www.omron.com/ecb/products/pdf/en-b3u.pdf?src-supplier=Digi-Key; ComponentLink4Description: http://www.omron.com/ecb/products/pdf/en-b3u.pdf?src-supplier=Digi-Key; ComponentLink5URL: https://www.distrelec.biz/Web/Downloads/he/et/B3U_eng_datasheet.pdf?mime=application%2Fpdf&src-supplier=Distrelec; ComponentLink5Description: https://www.distrelec.biz/Web/Downloads/he/et/B3U_eng_datasheet.pdf?mime=application%2Fpdf&src-supplier=Distrelec; ComponentLink6URL: http://www.onlinecomponents.com/productFiles/mf-OM/en-b3u.pdf?src-supplier=Onlinecomponents.com; ComponentLink6Description: http://www.onlinecomponents.com/productFiles/mf-OM/en-b3u.pdf?src-supplier=Onlinecomponents.com; Supplier 1: Digi-Key; Manufacturer Part Number: B3U-1000P; Stock 1: 116454; Pricing 1: 1=1, 10=0.961, 25=0.9064, 50=0.7976, 100=0.7251, 250=0.68888, 500=0.67074, 1000=0.52571 (USD); Mount: Surface Mount; Weight: 0.000776oz; Contact Material: Silver; Min Operating Temperature: -25°C; Max Operating Temperature: 70°C; Packaging: Tape and Reel; Voltage Rating (DC): 12V; Package Quantity: 1; Max Current Rating: 50mA; Termination: SMD/SMT; Orientation: Straight; Max Voltage Rating (DC): 12V; Electrical Life: 200000Cycles; Insulation Resistance: 100MR; Contact Current Rating: 50mA; Length: 4mm; Height: 1.2mm; Depth: 2.5mm; Width: 3mm; REACH SVHC: Unknown; Lead Free: Lead Free; ComponentLink7URL: https://www.verical.com/server-webapp/html/getDatasheet?partID=552554&src-supplier=Verical; ComponentLink7Description: https://www.verical.com/server-webapp/html/getDatasheet?partID=552554&src-supplier=Verical; ComponentLink8URL: http://www.farnell.com/datasheets/1685550.pdf?src-supplier=Element14; ComponentLink8Description: http://www.farnell.com/datasheets/1685550.pdf?src-supplier=Element14; ComponentLink9URL: http://www.farnell.com/datasheets/2610940.pdf?src-supplier=Farnell; ComponentLink9Description: http://www.farnell.com/datasheets/2610940.pdf?src-supplier=Farnell; ComponentLink10URL: https://www.alliedelec.com/m/d/4c8a9ef82804fc3c241a13c1e298fd73.pdf?src-supplier=Allied+Electronics; ComponentLink10Description: https://www.alliedelec.com/m/d/4c8a9ef82804fc3c241a13c1e298fd73.pdf?src-supplier=Allied+Electronics; Supplier Part Number 1: SW1020DKR-ND; LCSC Part Number: C231329; Item Type: Switch
SW3 = SS-12D10L9: 3A Direct Insert Single Pole Double Throw (SPDT) 125V Black 10,000 times Plugin Slide Switches ROHS; Manufacturer: XKB Connectivity; Item Type: Switch; Package: Plugin; LCSC Part Number: C319011; ComponentLink1Description: LCSC; ComponentLink1URL: https://www.lcsc.com/product-detail/Slide-Switches_XKB-Connection-SS-12D10L9_C319011.html
TP1 = 2 Test Pad: Wire Connecting Pad; Item Type: Test Point; Manufacturer Part Number: 2 Test Pad
TP2 TP3 = TEST POINT 0.5mm Dia: Test Point ON; Item Type: Test Point; Manufacturer Part Number: TEST POINT 0.5mm Dia
U1 = ESP32-C3-WROOM-02-N4: RF TXRX MOD BT WIFI PCB TH SMD; Manufacturer: Espressif Systems; Item Type: Module; Interface: 39,40,224,1514,1518,1532Interface; Bandwidth: 72MHz; Data Rate: 150Mbps; Clock Frequency: 2.484GHz; Max Supply Voltage: 3.6V; Min Supply Voltage: 3V; Number of GPIO: 15NUMBER; Supplier: Digikey; LCSC Part Number: C2934560; Manufacturer Part Number: ESP32-C3-WROOM-02-N4; RoHS: No; Pricing: 1=3.28, 10=2.836, 25=2.6796, 100=2.4652, 250=2.33652 (USD); Min Operating Temperature: -40°C; Max Operating Temperature: 85°C; Height: 3.35mm; ComponentLink1URL: https://datasheet.octopart.com/ESP32-C3-WROOM-02-N4-Espressif-Systems-datasheet-165560559.pdf?src-supplier=TME; ComponentLink1Description: https://datasheet.octopart.com/ESP32-C3-WROOM-02-N4-Espressif-Systems-datasheet-165560559.pdf?src-supplier=TME
U2 = TPS61023DRLR: IC REG BOOST ADJ 3A SOT563; Manufacturer: Texas Instruments; Supplier: Mouser; LCSC Part Number: C919459; Manufacturer Part Number: TPS61023DRLR; RoHS: Yes; Item Type: IC; Stock: 12004; Pricing: 1=0.89, 10=0.637, 50=0.574, 100=0.505, 1000=0.436, 10000=0.41 (USD); ComponentLink1URL: http://www.ti.com/general/docs/suppproductinfo.tsp?distId=10&amp;gotoUrl=http%3A%2F%2Fwww.ti.com%2Flit%2Fgpn%2Ftps61023&src-supplier=Digikey; ComponentLink1Description: http://www.ti.com/general/docs/suppproductinfo.tsp?distId=10&amp;gotoUrl=http%3A%2F%2Fwww.ti.com%2Flit%2Fgpn%2Ftps61023&src-supplier=Digikey
U3 = CD4069: 6 1uA 3V~15V SOP-14 Inverters ROHS; Manufacturer: Slkor(SLKORMICRO Elec.); Manufacturer Part Number: CD4069; Package: SOP-14; LCSC Part Number: C3041279; Item Type: Inverter; ComponentLink1Description: LCSC; ComponentLink1URL: https://www.lcsc.com/product-detail/Inverters_Slkor-SLKORMICRO-Elec-CD4069_C3041279.html?s_z=n_cd4069
X1 = Q13FC13500004: 32.768kHz Surface Mount Crystal 12.5pF ±20ppm SMD3215-2P Crystals ROHS; Manufacturer: Epson; Supplier: Farnell; LCSC Part Number: C32346; Manufacturer Part Number: Q13FC13500004; RoHS: Yes; Item Type: Crystals; Stock: 52665; Reach SVHC Compliant: 4187SVHC; ComponentLink1URL: https://datasheet.octopart.com/Q13FC13500004-Epson-datasheet-62043850.pdf?src-supplier=Farnell; ComponentLink1Description: https://datasheet.octopart.com/Q13FC13500004-Epson-datasheet-62043850.pdf?src-supplier=Farnell; ComponentLink2URL: https://datasheet.octopart.com/Q13FC13500004-Epson-datasheet-32025749.pdf?src-supplier=Newark; ComponentLink2Description: https://datasheet.octopart.com/Q13FC13500004-Epson-datasheet-32025749.pdf?src-supplier=Newark